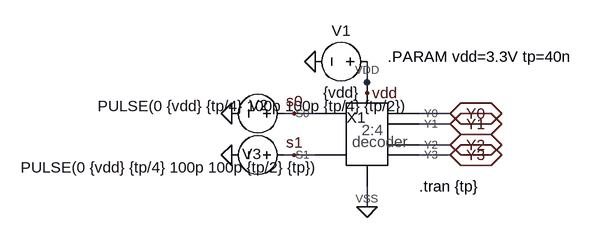
[diagram p0: schematic decoder24_tb_tran.asc]
decoder24_tb_tran.asc, the LTspice schematic file:
Version 4.1
SHEET 1 880 680
WIRE 192 80 192 48
WIRE 192 96 192 80
WIRE 192 112 192 96
WIRE 80 128 64 128
WIRE 112 128 80 128
WIRE 320 128 272 128
WIRE 320 144 272 144
WIRE 320 176 272 176
WIRE 80 192 64 192
WIRE 112 192 80 192
WIRE 320 192 272 192
WIRE 192 272 192 240
FLAG 112 48 0
FLAG 192 96 vdd
FLAG 320 176 Y2
IOPIN 320 176 BiDir
FLAG 320 192 Y3
IOPIN 320 192 BiDir
FLAG 320 144 Y1
IOPIN 320 144 BiDir
FLAG 320 128 Y0
IOPIN 320 128 BiDir
FLAG -16 128 0
FLAG -16 192 0
FLAG 192 272 0
FLAG 80 128 s0
FLAG 80 192 s1
SYMBOL voltage 208 48 R90
WINDOW 0 -32 56 VBottom 2
WINDOW 3 32 56 VTop 2
WINDOW 123 0 0 Left 0
WINDOW 39 0 0 Left 0
SYMATTR InstName V1
SYMATTR Value {vdd}
SYMBOL voltage 80 128 R90
WINDOW 0 2 55 VBottom 2
WINDOW 3 -27 61 VTop 2
WINDOW 123 0 0 Left 0
WINDOW 39 0 0 Left 0
SYMATTR InstName V2
SYMATTR Value PULSE(0 {vdd} {tp/4} 100p 100p {tp/4} {tp/2})
SYMBOL voltage 80 192 R90
WINDOW 123 0 0 Left 0
WINDOW 39 0 0 Left 0
WINDOW 0 -2 51 VRight 2
WINDOW 3 19 -42 VRight 2
SYMATTR InstName V3
SYMATTR Value PULSE(0 {vdd} {tp/4} 100p 100p {tp/2} {tp})
SYMBOL diglib\\decoder1x\\decoder24 208 160 R0
WINDOW 0 -47 -26 Left 2
SYMATTR InstName X1
TEXT 272 240 Left 2 !.tran {tp}
TEXT 224 40 Left 2 !.PARAM vdd=3.3V tp=40n

The netlist it stands for:
* decoder24_tb_tran.asc
V1 vdd 0 {vdd}
V2 s0 0 PULSE(0 {vdd} {tp/4} 100p 100p {tp/4} {tp/2})
V3 s1 0 PULSE(0 {vdd} {tp/4} 100p 100p {tp/2} {tp})
X§X1 Y0 Y3 vdd s0 0 Y1 Y2 s1 decoder24  ; pins Y0 Y3 VDD S0 VSS Y1 Y2 S1
.tran {tp}
.PARAM vdd=3.3V tp=40n
.backanno
.end